# Altium schematic sheet SMSP_Schematic.SchDoc
size A4
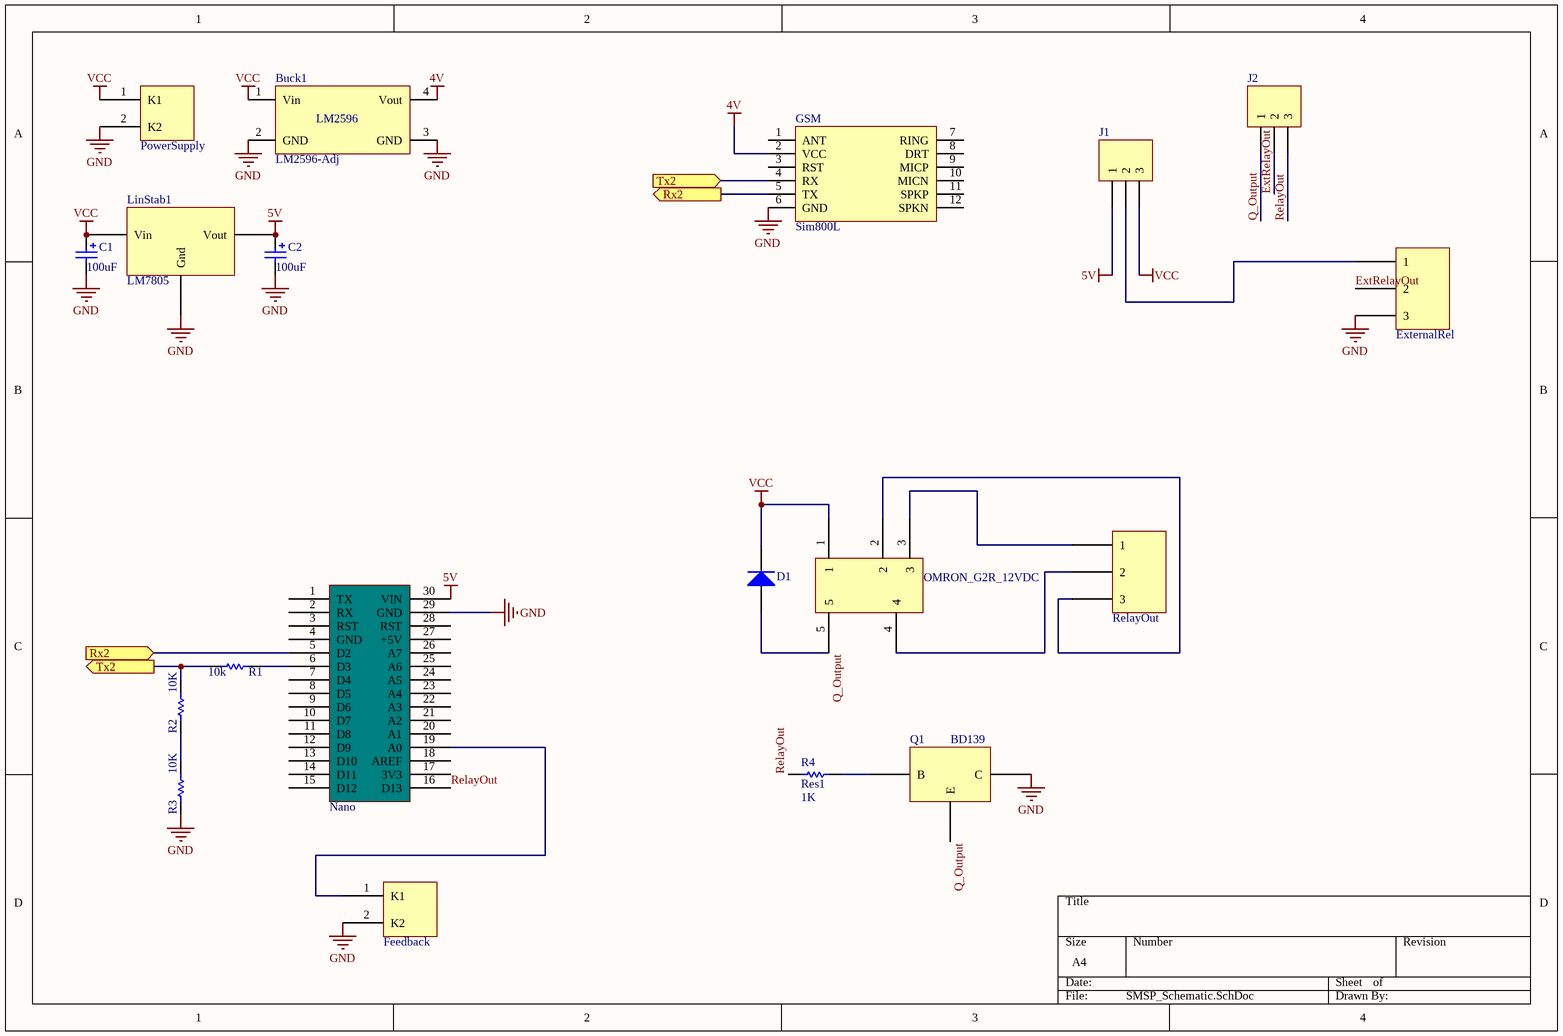
[diagram p0: SMSP_Schematic.SchDoc]

## Parts
Buck1  LM2596-Adj  [lm2596]
C1  value 100uF  [Electrolytic_Capacitor]  (hidden comment: Cap Pol1)
C2  value 100uF  [Electrolytic_Capacitor]  (hidden comment: Cap Pol1)
D1  Diode 1N4007  [DO-41]  (value not drawn)
ExternalRel  klema  [klema3]  (value not drawn)
Feedback  Klema  [Klema]  (value not drawn)
GSM  Sim800L  [Sim800L]
J1  Header 3  [HDR1X3]  (value not drawn)
J2  Header 3  [HDR1X3]  (value not drawn)
LinStab1  LM7805  [LM7805]
Nano  mcu  [ArduinoNano]  (value not drawn)
OMRON_G2R_12VDC  12V Relay  [OMRON_G2R]  (value not drawn)
PowerSupply  Klema  [Klema]  (value not drawn)
Q1  BD139  [BD139]
R1  value 10k  [AXIAL-0.3]  (hidden comment: Res1)
R2  value 10K  [AXIAL-0.3]  (hidden comment: Res1)
R3  value 10K  [AXIAL-0.3]  (hidden comment: Res1)
R4  Res1  value 1K  [AXIAL-0.3]
RelayOut  klema  [klema3]  (value not drawn)

## Ports
Rx2 (in), Rx2 (out), Tx2 (in), Tx2 (out)

## Nets
4V: Buck1.4(Vout) GSM.2(VCC)
5V: C2.1 J1.1 LinStab1.3(Vout) Nano.30(VIN)
GND: Buck1.2(GND) Buck1.3(GND) C1.2 C2.2 ExternalRel.3 Feedback.2(K2) GSM.6(GND) LinStab1.2(Gnd) Nano.29(GND) PowerSupply.2(K2) Q1.2(C) R3.1
VCC: Buck1.1(Vin) C1.1 D1.2(K) J1.3 LinStab1.1(Vin) OMRON_G2R_12VDC.1 PowerSupply.1(K1)
ExtRelayOut: ExternalRel.2 J2.2
Q_Output: D1.1(A) J2.1 OMRON_G2R_12VDC.5 Q1.1(E)
RelayOut: J2.3 Nano.16(D13) R4.1
Rx2: GSM.5(TX) Nano.5(D2) ; port Rx2
Tx2: GSM.4(RX) R1.1 R2.2 ; port Tx2
NetExternalRel_1: ExternalRel.1 J1.2
NetFeedback_1: Feedback.1(K1) Nano.19(A0)
NetNano_6: Nano.6(D3) R1.2
NetOMRON_G2R_12VDC_2: OMRON_G2R_12VDC.2 RelayOut.3
NetOMRON_G2R_12VDC_3: OMRON_G2R_12VDC.3 RelayOut.1
NetOMRON_G2R_12VDC_4: OMRON_G2R_12VDC.4 RelayOut.2
NetQ1_3: Q1.3(B) R4.2
NetR2_1: R2.1 R3.2

Not connected (* = marked no-connect by the designer): GSM 1(ANT) 3(RST) 7(RING) 8(DRT) 9(MICP) 10(MICN) 11(SPKP) 12(SPKN); Nano 1(TX) 2(RX) 3(RST) 4(GND) 7(D4) 8(D5) 9(D6) 10(D7) 11(D8) 12(D9) 13(D10) 14(D11) 15(D12) 17(3V3) 18(AREF) 20(A1) 21(A2) 22(A3) 23(A4) 24(A5) 25(A6) 26(A7) 27(+5V) 28(RST)

## Notes on the sheet
- (in symbol LM2596-Adj) LM2596

## Library data of the parts
Buck1 = LM2596-Adj: Designed By @Alixahedi
C1 C2 = Cap Pol1: Polarized Capacitor (Radial); Published: 8-Jun-2000; LatestRevisionDate: 17-Jul-2002; LatestRevisionNote: Re-released for DXP Platform.; PackageReference: RB7.6-15; Publisher: Altium Limited; PackageDescription: Polarized Capacitor (Radial); 2 Leads
D1 = Diode 1N4007: 1 Amp General Purpose Rectifier; Published: 8-Jun-2000; LatestRevisionDate: 17-Jul-2002; LatestRevisionNote: Re-released for DXP Platform.; DatasheetVersion: 1998; PackageVersion: Aug-1999; PackageReference: DO-41; Publisher: Altium Limited; PackageDescription: Diode, Axial; Body 5.2 x 2.7 mm (LxDia. max), Lead Dia. 0.86 mm (max); Code_JEDEC: DO-204-AL; ComponentLink1Description: Manufacturer Link; ComponentLink1URL: http://www.fairchildsemi.com/; ComponentLink2Description: Datasheet; ComponentLink2URL: http://www.fairchildsemi.com/ds/1N%2F1N4001.pdf
ExternalRel RelayOut = klema3
Feedback PowerSupply = Klema: 2 pina
J1 J2 = Header 3: Header, 3-Pin; LatestRevisionDate: 17-Jul-2002; LatestRevisionNote: Re-released for DXP Platform.; Publisher: Altium Limited
LinStab1 = LM7805: Stabilizator
Nano = ArduinoNano: Arduino Nano from Microchip
OMRON_G2R_12VDC = OMRON_G2R_12VDC
R1-R4 = Res1: Resistor; Published: 8-Jun-2000; LatestRevisionDate: 17-Jul-2002; LatestRevisionNote: Re-released for DXP Platform.; PackageReference: AXIAL-0.3; Publisher: Altium Limited; PackageDescription: Axial Device, Thru-Hole; 2 Leads; 0.3 in Pin Spacing